# Altium project Kill_Switch_JV.PrjPCB
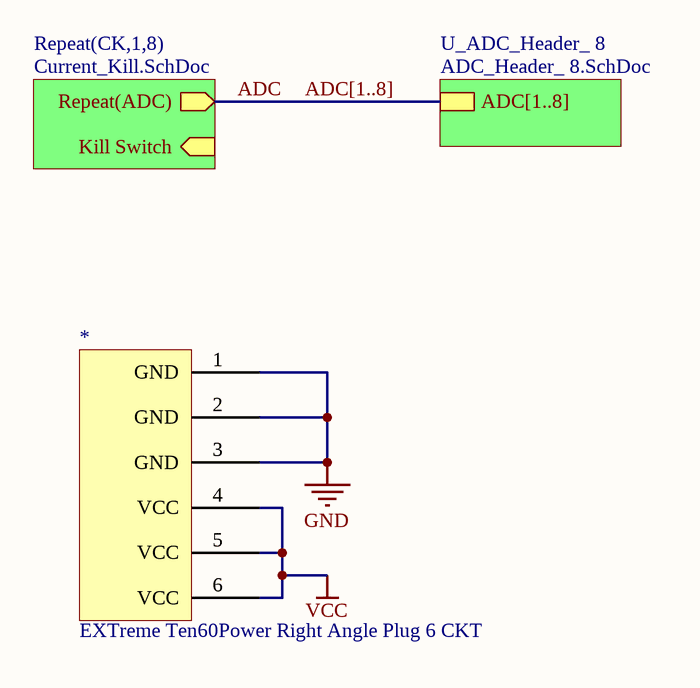
[diagram p0: Top.SchDoc]
3 sheets, 42 parts. Net scope: hierarchical (ports join the sheet entries above them; power ports are global).
Board file: Kill_Switch_4_Layer_JV.PcbDoc
Sheets:
  Top.SchDoc
    CK1 = Current_Kill.SchDoc
    CK2 = Current_Kill.SchDoc
    CK3 = Current_Kill.SchDoc
    CK4 = Current_Kill.SchDoc
    CK5 = Current_Kill.SchDoc
    CK6 = Current_Kill.SchDoc
    CK7 = Current_Kill.SchDoc
    CK8 = Current_Kill.SchDoc
    U_ADC_Header_ 8 = ADC_Header_ 8.SchDoc

## Sheet Top.SchDoc
size A

### Parts
*  EXTreme Ten60Power Right Angle Plug 6 CKT  [EXTreme Ten60Power Right Angle Plug 6 CKT]

### Sub-sheets
Repeat(CK,1,8) = Current_Kill.SchDoc: Kill Switch (in), Repeat(ADC) (out)
U_ADC_Header_ 8 = ADC_Header_ 8.SchDoc: ADC[1..8]

### Nets
GND: *.1(GND) *.2(GND) *.3(GND)
VCC: *.4(VCC) *.5(VCC) *.6(VCC)
ADC: sheet Repeat(CK,1,8)/Repeat(ADC)  [also labelled ADC[1..8]]

## Sheet Current_Kill.SchDoc
size A
Used 8 times, as channels CK1, CK2, CK3, CK4, CK5, CK6, CK7, CK8. Parts and nets are listed once, with the designators drawn on the sheet.
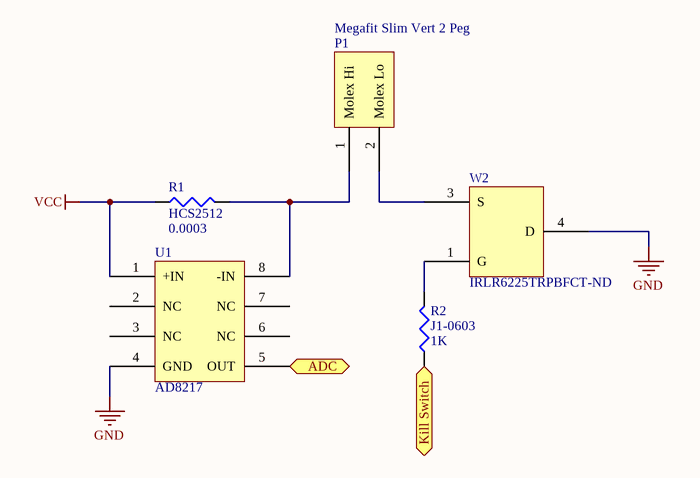
[diagram p1: Current_Kill.SchDoc]

### Parts
P1  Megafit Slim Vert 2 Peg  [76829-0102]
R1  HCS2512  value 0.0003  [HCS2512FTL300CT-ND_DT]
R2  J1-0603  value 1K  [J1-0603]
U1  AD8217  [AD8217_DT]
W2  IRLR6225TRPBFCT-ND  [IRLR6225_DT]

### Ports
ADC (out), Kill Switch (in)

### Nets
GND: U1.4(GND) W2.4(D)
VCC: R1.1 U1.1(+IN)
ADC: U1.5(OUT) ; port ADC
Kill Switch: R2.1 ; port Kill Switch
NetP1_1: P1.1(Molex_Hi) R1.2 U1.8(-IN)
NetP1_2: P1.2(Molex_Lo) W2.3(S)
NetR2_2: R2.2 W2.1(G)

Not connected (* = marked no-connect by the designer): U1 2(NC) 3(NC) 6(NC) 7(NC)

### Channels
CK1: designators end in _CK1; ports ADC=ADC1 Kill Switch=NetR2_CK1_1
CK2: designators end in _CK2; ports ADC=ADC2 Kill Switch=NetR2_CK1_1
CK3: designators end in _CK3; ports ADC=ADC3 Kill Switch=NetR2_CK1_1
CK4: designators end in _CK4; ports ADC=ADC4 Kill Switch=NetR2_CK1_1
CK5: designators end in _CK5; ports ADC=ADC5 Kill Switch=NetR2_CK1_1
CK6: designators end in _CK6; ports ADC=ADC6 Kill Switch=NetR2_CK1_1
CK7: designators end in _CK7; ports ADC=ADC7 Kill Switch=NetR2_CK1_1
CK8: designators end in _CK8; ports ADC=ADC8 Kill Switch=NetR2_CK1_1

### Library data of the parts
R1 = Res3: Resistor; mfgr_part_num: HCS2512FTL300; Published: 8-Jun-2000; LatestRevisionDate: 29-May-2009; LatestRevisionNote: IPC-7351 Footprint Added.; PackageReference: J1-0603; Publisher: Altium Limited; PackageDescription: Chip Resistor
R2 = Res3: Resistor; Published: 8-Jun-2000; LatestRevisionDate: 29-May-2009; LatestRevisionNote: IPC-7351 Footprint Added.; PackageReference: J1-0603; Publisher: Altium Limited; PackageDescription: Chip Resistor
U1 = AD8217: mfgr_part_num: AD8217BRMZ-R7
P1 = Megafit Slim Vert 2 Peg: mfgr_part_num: 76829-0102
W2 = IRLR6225TRPBFCT-ND: mnfr_part_num: IRLR6225TRPBF

## Sheet ADC_Header_ 8.SchDoc
size A4
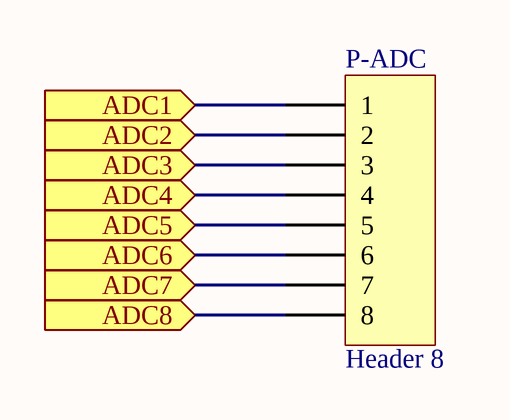
[diagram p2: ADC_Header_ 8.SchDoc]

### Parts
P-ADC  Header 8  [HDR1X8]

### Ports
ADC1, ADC2, ADC3, ADC4, ADC5, ADC6, ADC7, ADC8

### Nets
NetP-ADC_1: P-ADC.1 ; port ADC1
NetP-ADC_2: P-ADC.2 ; port ADC2
NetP-ADC_3: P-ADC.3 ; port ADC3
NetP-ADC_4: P-ADC.4 ; port ADC4
NetP-ADC_5: P-ADC.5 ; port ADC5
NetP-ADC_6: P-ADC.6 ; port ADC6
NetP-ADC_7: P-ADC.7 ; port ADC7
NetP-ADC_8: P-ADC.8 ; port ADC8

### Library data of the parts
P-ADC = Header 8: Header, 8-Pin; LatestRevisionDate: 17-Jul-2002; LatestRevisionNote: Re-released for DXP Platform.; Publisher: Altium Limited

## Nets that join several sheets
GND: Top (*.1 *.2 *.3), CK1 (U1_CK1.4 W2_CK1.4), CK2 (U1_CK2.4 W2_CK2.4), CK3 (U1_CK3.4 W2_CK3.4), CK4 (U1_CK4.4 W2_CK4.4), CK5 (U1_CK5.4 W2_CK5.4), CK6 (U1_CK6.4 W2_CK6.4), CK7 (U1_CK7.4 W2_CK7.4), CK8 (U1_CK8.4 W2_CK8.4)
VCC: Top (*.4 *.5 *.6), CK1 (R1_CK1.1 U1_CK1.1), CK2 (R1_CK2.1 U1_CK2.1), CK3 (R1_CK3.1 U1_CK3.1), CK4 (R1_CK4.1 U1_CK4.1), CK5 (R1_CK5.1 U1_CK5.1), CK6 (R1_CK6.1 U1_CK6.1), CK7 (R1_CK7.1 U1_CK7.1), CK8 (R1_CK8.1 U1_CK8.1)
NetR2_CK1_1: CK1 (R2_CK1.1), CK2 (R2_CK2.1), CK3 (R2_CK3.1), CK4 (R2_CK4.1), CK5 (R2_CK5.1), CK6 (R2_CK6.1), CK7 (R2_CK7.1), CK8 (R2_CK8.1)